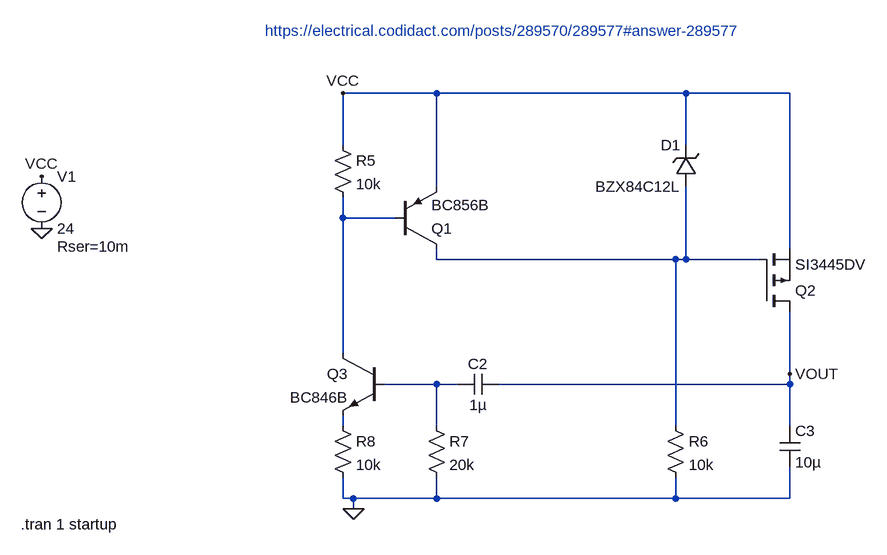
[diagram p0: schematic soft_start.asc]
soft_start.asc, the LTspice schematic file:
Version 4
SHEET 1 912 680
WIRE 240 -160 96 -160
WIRE 624 -160 240 -160
WIRE 784 -160 624 -160
WIRE 96 -80 96 -160
WIRE 624 -80 624 -160
WIRE 240 -16 240 -160
WIRE 96 32 96 0
WIRE 176 32 96 32
WIRE 784 80 784 -160
WIRE 240 96 240 80
WIRE 608 96 240 96
WIRE 624 96 624 -16
WIRE 624 96 608 96
WIRE 736 96 624 96
WIRE 96 240 96 32
WIRE 784 272 784 176
WIRE 240 288 160 288
WIRE 272 288 240 288
WIRE 784 288 784 272
WIRE 784 288 336 288
WIRE 96 352 96 336
WIRE 240 352 240 288
WIRE 608 352 608 96
WIRE 784 352 784 288
WIRE 96 464 96 432
WIRE 112 464 96 464
WIRE 240 464 240 432
WIRE 240 464 112 464
WIRE 608 464 608 432
WIRE 608 464 240 464
WIRE 784 464 784 416
WIRE 784 464 608 464
WIRE 112 480 112 464
FLAG -368 48 0
FLAG -368 -32 VCC
FLAG 112 480 0
FLAG 96 -160 VCC
FLAG 784 272 VOUT
SYMBOL res 80 -96 R0
SYMATTR InstName R5
SYMATTR Value 10k
SYMBOL res 80 336 R0
SYMATTR InstName R8
SYMATTR Value 10k
SYMBOL res 592 336 R0
SYMATTR InstName R6
SYMATTR Value 10k
SYMBOL res 224 336 R0
SYMATTR InstName R7
SYMATTR Value 20k
SYMBOL npn 160 240 M0
SYMATTR InstName Q3
SYMATTR Value BC846B
SYMBOL pnp 176 80 M180
SYMATTR InstName Q1
SYMATTR Value BC856B
SYMBOL pmos 736 176 M180
SYMATTR InstName Q2
SYMATTR Value SI3445DV
SYMBOL cap 768 352 R0
SYMATTR InstName C3
SYMATTR Value 10µ
SYMBOL cap 336 272 R90
WINDOW 0 0 32 VBottom 2
WINDOW 3 32 32 VTop 2
SYMATTR InstName C2
SYMATTR Value 1µ
SYMBOL zener 640 -16 R180
WINDOW 0 24 64 Left 2
WINDOW 3 24 0 Left 2
SYMATTR InstName D1
SYMATTR Value BZX84C12L
SYMATTR Description Diode
SYMATTR Type diode
SYMBOL voltage -368 -48 R0
WINDOW 123 0 0 Left 0
WINDOW 39 24 124 Left 2
SYMATTR SpiceLine Rser=10m
SYMATTR InstName V1
SYMATTR Value 24
TEXT -400 504 Left 2 !.tran 1 startup
TEXT -24 -256 Left 2 ;https://electrical.codidact.com/posts/289570/289577#answer-289577

The netlist it stands for:
* soft_start.asc
R5 VCC N001 10k
R8 N004 0 10k
R6 N002 0 10k
R7 N003 0 20k
Q3 N001 N003 N004 0 BC846B
Q1 N002 N001 VCC 0 BC856B
M§Q2 VOUT N002 VCC VCC SI3445DV
C3 VOUT 0 10µ
C2 VOUT N003 1µ
D1 N002 VCC BZX84C12L
V1 VCC 0 24 Rser=10m
.model D D
.lib standard.dio
.model NPN NPN
.model PNP PNP
.lib standard.bjt
.model NMOS NMOS
.model PMOS PMOS
.lib standard.mos
.tran 1 startup
* https://electrical.codidact.com/posts/289570/289577#answer-289577
.backanno
.end